# Altium schematic sheet Power_Section.SchDoc
size A4
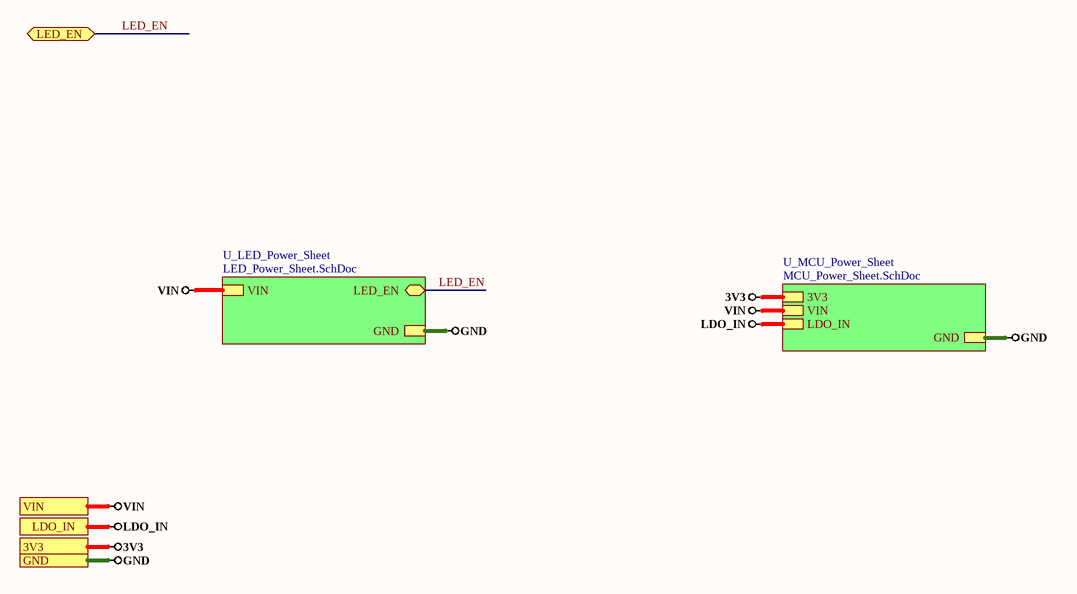
[diagram p0: Power_Section.SchDoc]

## Sub-sheets
U_LED_Power_Sheet = LED_Power_Sheet.SchDoc: GND, VIN, LED_EN (bidir)
U_MCU_Power_Sheet = MCU_Power_Sheet.SchDoc: 3V3, GND, LDO_IN, VIN

## Ports
3V3, GND, LDO_IN, LED_EN (bidir), VIN

## Nets
3V3: port 3V3, sheet U_MCU_Power_Sheet/3V3
GND: port GND, sheet U_MCU_Power_Sheet/GND, sheet U_LED_Power_Sheet/GND
LDO_IN: port LDO_IN, sheet U_MCU_Power_Sheet/LDO_IN
VIN: port VIN, sheet U_MCU_Power_Sheet/VIN, sheet U_LED_Power_Sheet/VIN
LED_EN: port LED_EN, sheet U_LED_Power_Sheet/LED_EN